# Altium schematic sheet Sheet1.SchDoc (part 1 of 2)
size A; SheetNumber: 1; SheetTotal: 3
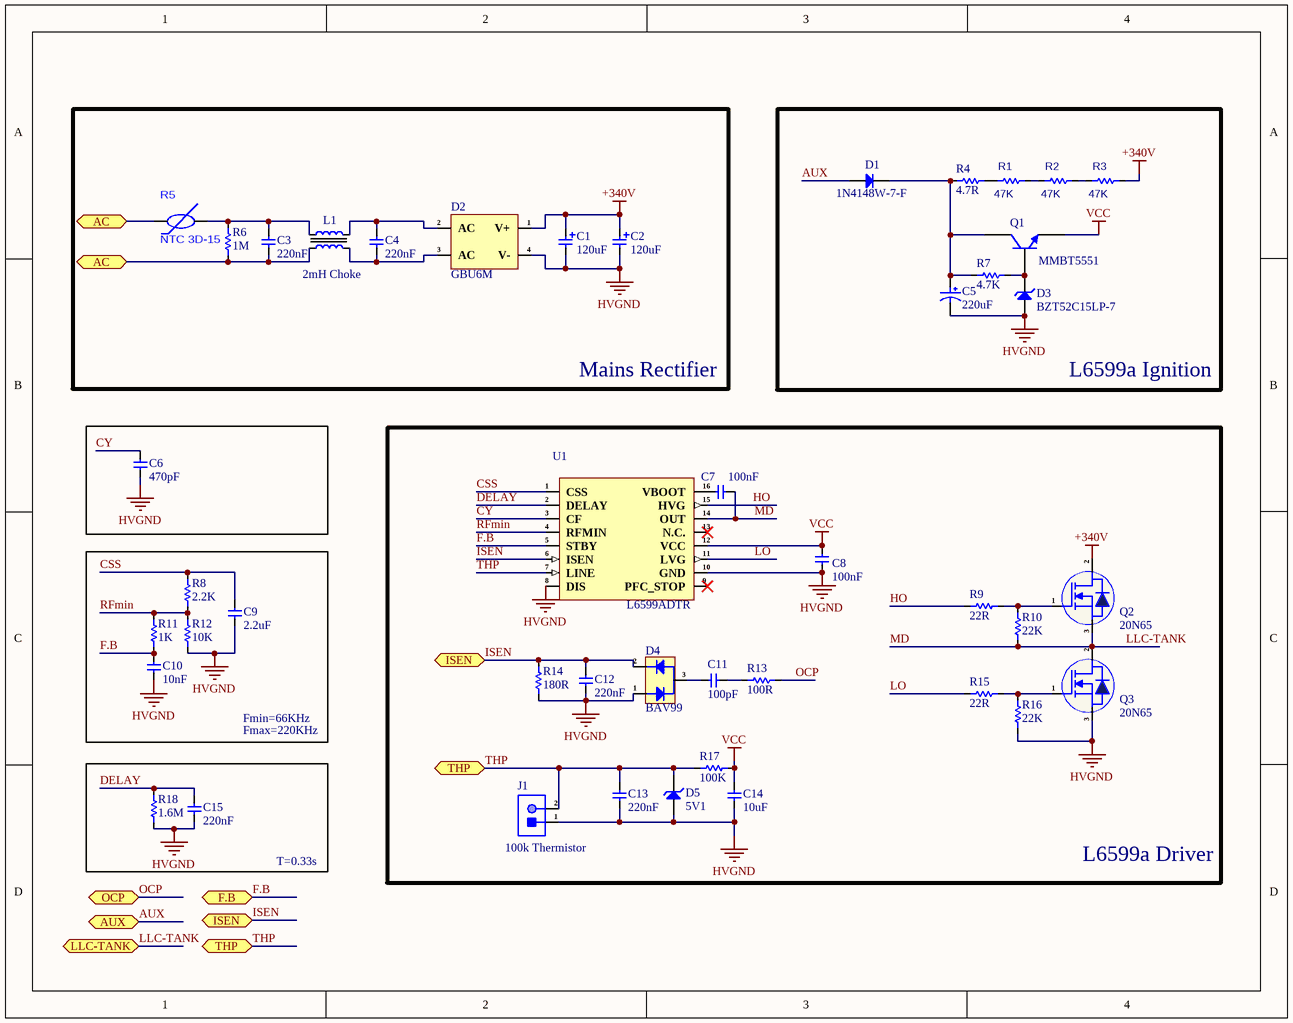
[diagram p0: Sheet1.SchDoc]

## Parts
C1  120uF  [CAP-TH_BD18.0-P7.5-D0.8-FD]
C2  120uF  [CAP-TH_BD18.0-P7.5-D0.8-FD]
C3  220nF  [CAP-TH_L18.0-W7.0-P15.00-D0.7]
C4  220nF  [CAP-TH_L18.0-W7.0-P15.00-D0.7]
C5  220uF  [EEEFT1H221AP]
C6  470pF  [Cap-0603]
C7  100nF  [Cap-0603]
C8  100nF  [Cap-0603]
C9  2.2uF  [Cap-0603]
C10  10nF  [Cap-0603]
C11  100pF  [Cap-0603]
C12  220nF  [Cap-0805]
C13  220nF  [Cap-0805]
C14  10uF  [Cap-0805]
C15  220nF  [Cap-0805]
D1  1N4148W-7-F  [SOD-123]
D2  GBU6M  [DIO-BG-TH_GBU]
D3  BZT52C15LP-7  [DFN1006-2L_]
D4  BAV99  [DIO_BAV99]
D5  5V1  [SMB_]
J1  100k Thermistor  [HDR1X2_]
L1  2mH Choke  [2mH Choke]
Q1  MMBT5551  [SOT-23]
Q2  20N65  [TO254P1050X476X2020-3]
Q3  20N65  [TO254P1050X476X2020-3]
R1  47K  [RES-0805]
R2  47K  [RES-0805]
R3  47K  [RES-0805]
R4  4.7R  [Res-0603]
R5  NTC 3D-15  [RES-TH_L17.0-W5.5-P7.50-D1.2]
R6  1M  [1/4W THT Resistor]
R7  4.7K  [Res-0603]
R8  2.2K  [Res-0603]
R9  22R  [Res-0603]
R10  22K  [Res-0603]
R11  1K  [Res-0603]
R12  10K  [Res-0603]
R13  100R  [Res-0603]
R14  180R  [Res-0603]
R15  22R  [Res-0603]
R16  22K  [Res-0603]
R17  100K  [RES-0603]
R18  1.6M  [Res-0603]
U1  L6599ADTR  [SOIC127P600X175-16N]

## Blocks framed on the sheet
Mains Rectifier: C1-C4 D2 L1 R5 R6
L6599a Ignition: C5 D1 D3 Q1 R1-R4 R7
L6599a Driver: C7 C8 C11-C14 D4 D5 J1 Q2 Q3 R9 R10 R13-R17 U1
T=0.33s: C15 R18

## Ports
AC (bidir), AUX (bidir), F.B (bidir), ISEN (bidir), LLC-TANK (bidir), OCP (bidir), THP (bidir)

## Nets
+340V: C1.1 C2.1 D2.1(V+) Q2.2(D) R3.2
HVGND: C1.2 C2.2 C5.2 C6.1 C8.1 C9.1 C10.1 C12.1 C13.1 C14.1 C15.1 D2.4(V-) D3.2(A) D4.1 D5.1(A) J1.1 Q3.3(S) R12.1 R14.1 R16.1 R18.1 U1.8(DIS) U1.10(GND)
VCC: C8.2 C14.2 Q1.2(E) R17.2 U1.12(VCC)
AC: C3.1 L1.2 R5.1 R6.2 ; port AC
AUX: D1.1(A) ; port AUX
CSS: C9.2 R8.2 U1.1(CSS)
CY: C6.2 U1.3(CF)
DELAY: C15.2 R18.2 U1.2(DELAY)
F.B: C10.2 R11.1 U1.5(STBY) ; port F.B
HO: R9.1 U1.15(HVG)
ISEN: C12.2 D4.2 R14.2 U1.6(ISEN) ; port ISEN
LLC-TANK: C7.2 Q2.3(S) Q3.2(D) R10.1 U1.14(OUT) ; port LLC-TANK  [also labelled MD]
LO: R15.1 U1.11(LVG)
OCP: R13.2 ; port OCP
RFmin: R8.1 R11.2 R12.2 U1.4(RFMIN)
THP: C13.2 D5.2(K) J1.2 R17.1 U1.7(LINE) ; port THP
NetC3_2: C3.2 L1.1 R5.2 R6.1
NetC4_1: C4.1 D2.3(AC) L1.4
NetC4_2: C4.2 D2.2(AC) L1.3
NetC5_1: C5.1 D1.2(K) Q1.3(C) R4.1 R7.1
NetC7_1: C7.1 U1.16(VBOOT)
NetC11_1: C11.1 D4.3
NetC11_2: C11.2 R13.1
NetD3_1: D3.1(K) Q1.1(B) R7.2
NetQ2_1: Q2.1(G) R9.2 R10.2
NetQ3_1: Q3.1(G) R15.2 R16.2
NetR1_1: R1.1 R4.2
NetR1_2: R1.2 R2.1
NetR2_2: R2.2 R3.1

Not connected (* = marked no-connect by the designer): U1 9(PFC_STOP)* 13(N.C.)*

## Notes on the sheet
- Fmin=66KHz
- Fmax=220KHz